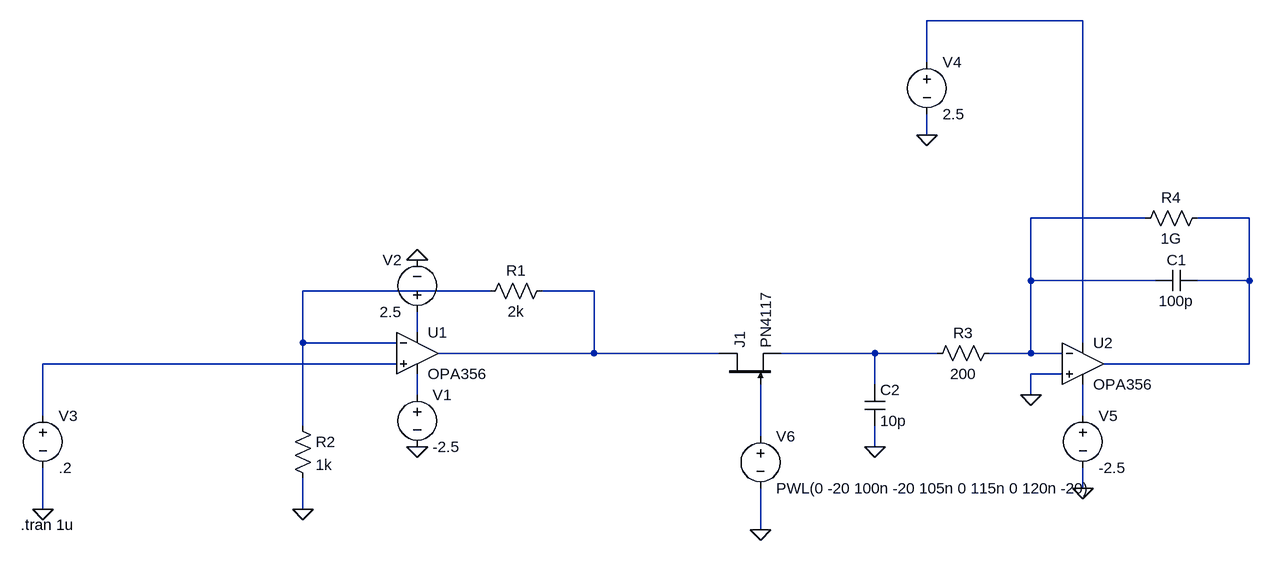
[diagram p0: schematic Draft1.asc]
Draft1.asc, the LTspice schematic file:
Version 4
SHEET 1 1496 680
WIRE 1232 -336 992 -336
WIRE 992 -272 992 -336
WIRE 992 -160 992 -192
WIRE 1328 -32 1152 -32
WIRE 1488 -32 1408 -32
WIRE 1152 64 1152 -32
WIRE 1344 64 1152 64
WIRE 1488 64 1488 -32
WIRE 1488 64 1408 64
WIRE 320 80 32 80
WIRE 480 80 400 80
WIRE 208 144 208 112
WIRE 32 160 32 80
WIRE 176 160 32 160
WIRE 1232 160 1232 -336
WIRE 480 176 480 80
WIRE 480 176 240 176
WIRE 672 176 480 176
WIRE 912 176 768 176
WIRE 1008 176 912 176
WIRE 1152 176 1152 64
WIRE 1152 176 1088 176
WIRE 1200 176 1152 176
WIRE 176 192 -368 192
WIRE 1488 192 1488 64
WIRE 1488 192 1264 192
WIRE 1200 208 1152 208
WIRE 912 224 912 176
WIRE 208 240 208 208
WIRE 1152 240 1152 208
WIRE -368 272 -368 192
WIRE 1232 272 1232 224
WIRE 32 288 32 160
WIRE 736 304 736 224
WIRE 912 320 912 288
WIRE 1232 384 1232 352
WIRE -368 416 -368 352
WIRE 32 416 32 368
WIRE 736 448 736 384
FLAG 208 320 0
FLAG 208 32 0
FLAG 32 416 0
FLAG -368 416 0
FLAG 992 -160 0
FLAG 1232 384 0
FLAG 1152 240 0
FLAG 736 448 0
FLAG 912 320 0
SYMBOL OPA356 208 112 R0
SYMATTR InstName U1
SYMBOL voltage 208 224 R0
WINDOW 123 0 0 Left 0
WINDOW 39 0 0 Left 0
SYMATTR InstName V1
SYMATTR Value -2.5
SYMBOL voltage 208 128 R180
WINDOW 0 24 96 Left 2
WINDOW 3 24 16 Left 2
WINDOW 123 0 0 Left 0
WINDOW 39 0 0 Left 0
SYMATTR InstName V2
SYMATTR Value 2.5
SYMBOL res 416 64 R90
WINDOW 0 0 56 VBottom 2
WINDOW 3 32 56 VTop 2
SYMATTR InstName R1
SYMATTR Value 2k
SYMBOL res 16 272 R0
SYMATTR InstName R2
SYMATTR Value 1k
SYMBOL voltage -368 256 R0
WINDOW 123 0 0 Left 0
WINDOW 39 0 0 Left 0
SYMATTR InstName V3
SYMATTR Value .2
SYMBOL OPA356 1232 128 R0
SYMATTR InstName U2
SYMBOL res 1104 160 R90
WINDOW 0 0 56 VBottom 2
WINDOW 3 32 56 VTop 2
SYMATTR InstName R3
SYMATTR Value 200
SYMBOL cap 1408 48 R90
WINDOW 0 0 32 VBottom 2
WINDOW 3 32 32 VTop 2
SYMATTR InstName C1
SYMATTR Value 100p
SYMBOL res 1424 -48 R90
WINDOW 0 0 56 VBottom 2
WINDOW 3 32 56 VTop 2
SYMATTR InstName R4
SYMATTR Value 1G
SYMBOL voltage 992 -288 R0
WINDOW 123 0 0 Left 0
WINDOW 39 0 0 Left 0
SYMATTR InstName V4
SYMATTR Value 2.5
SYMBOL voltage 1232 256 R0
WINDOW 123 0 0 Left 0
WINDOW 39 0 0 Left 0
SYMATTR InstName V5
SYMATTR Value -2.5
SYMBOL njf 672 224 R270
SYMATTR InstName J1
SYMATTR Value PN4117
SYMBOL voltage 736 288 R0
WINDOW 123 0 0 Left 0
WINDOW 39 0 0 Left 0
SYMATTR InstName V6
SYMATTR Value PWL(0 -20 100n -20 105n 0 115n 0 120n -20)
SYMBOL cap 896 224 R0
SYMATTR InstName C2
SYMATTR Value 10p
TEXT -402 440 Left 2 !.tran 1u

The netlist it stands for:
* Draft1.asc
* U1: OPA356 (symbol OPA356 not available, pins judged from their places): In+=N008 In-=N004 V+=N006 V-=N009 OUT=N005
V1 N009 0 -2.5
V2 N006 0 2.5
R1 N005 N004 2k
R2 N004 0 1k
V3 N008 0 .2
* U2: OPA356 (symbol OPA356 not available, pins judged from their places): In+=0 In-=N002 V+=N001 V-=N010 OUT=N003
R3 N002 N007 200
C1 N003 N002 100p
R4 N003 N002 1G
V4 N001 0 2.5
V5 N010 0 -2.5
J1 N005 N011 N007 PN4117
V6 N011 0 PWL(0 -20 100n -20 105n 0 115n 0 120n -20)
C2 N007 0 10p
.model NJF NJF
.model PJF PJF
.lib standard.jft
.tran 1u
.backanno
.end